# Altium schematic sheet Tiny_Matrix_Sch.SchDoc
size A; SheetNumber: 1; SheetTotal: 1
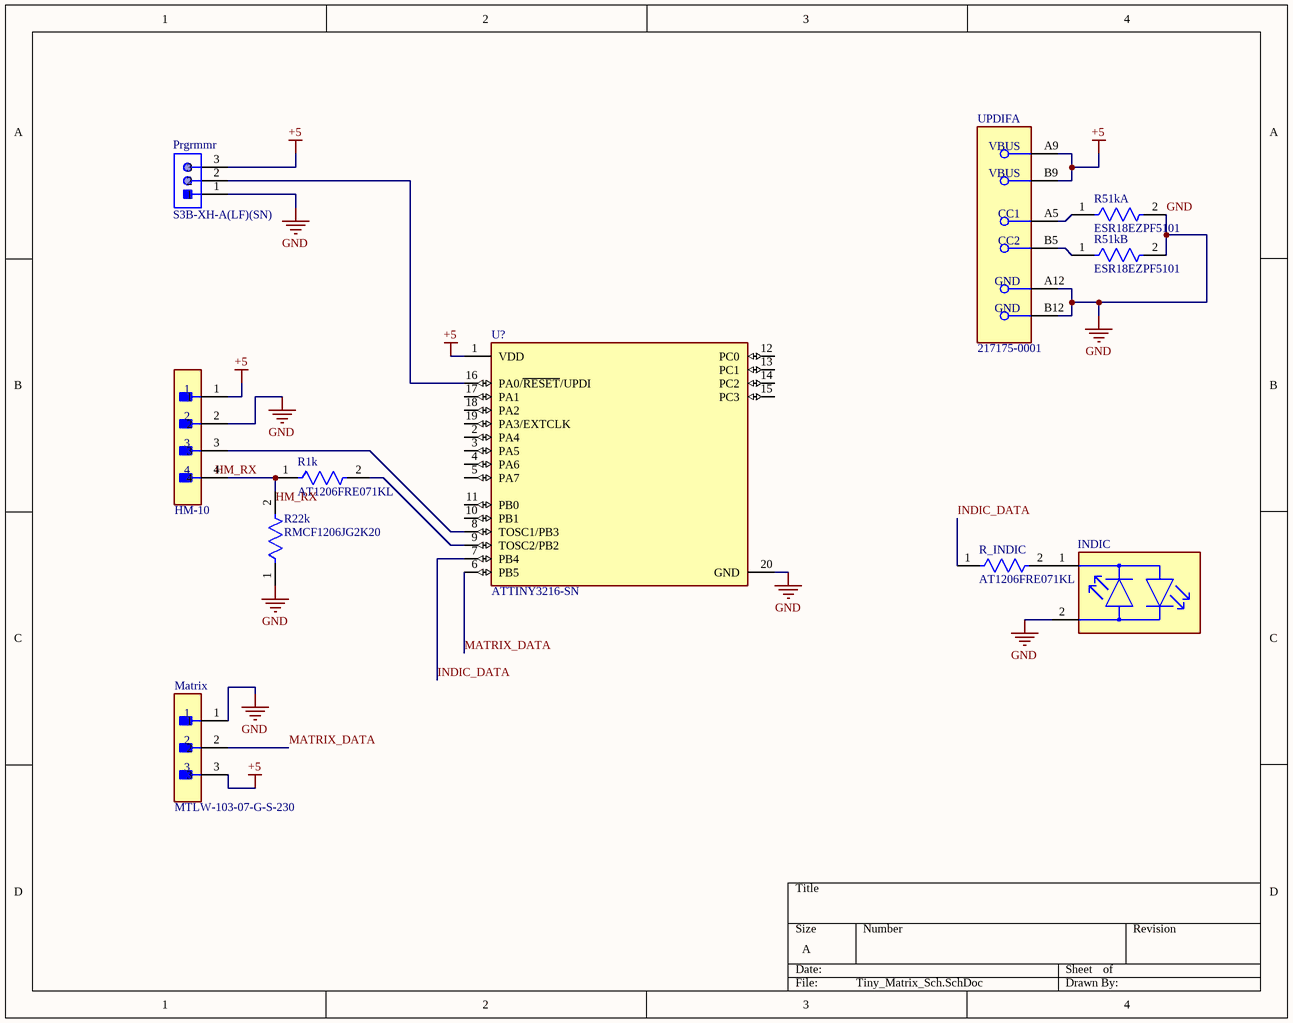
[diagram p0: Tiny_Matrix_Sch.SchDoc]

## Parts
HM-10  BT Module  [FP-MTLW-104-05-G-S-185-MFG]  (value not drawn)
INDIC  L-57IID  [FP-L-57IID-MFG]  (value not drawn)
Matrix  MTLW-103-07-G-S-230  [FP-MTLW-103-07-G-S-230-MFG]
Prgrmmr  S3B-XH-A(LF)(SN)  [JST-S3B-XH-A(LF)(SN)_V]
R1k  AT1206FRE071KL  [FP-AT1206-MFG]
R22k  RMCF1206JG2K20  [FP-RMCF1206-MFG]
R51kA  ESR18EZPF5101  [FP-ESR18-IPC_A]
R51kB  ESR18EZPF5101  [FP-ESR18-IPC_A]
R_INDIC  AT1206FRE071KL  [FP-AT1206-MFG]
U?  ATTINY3216-SN  [FP-C04-094-IPC_B]
UPDIF  217175-0001  [FP-217175-0001-MFG]  (part A of 2)

## Nets
+5: HM-10.1 Matrix.3 Prgrmmr.3 U?.1(VDD) UPDIF.A9(VBUS) UPDIF.B9(VBUS)
GND: HM-10.2 INDIC.2(1_ANODE/2_CATHODE) Matrix.1 Prgrmmr.1 R22k.1 R51kA.2 R51kB.2 U?.20(GND) UPDIF.A12(GND) UPDIF.B12(GND)
INDIC_DATA: R_INDIC.1 U?.7(PB4)
MATRIX_DATA: Matrix.2 U?.6(PB5)
NetHM-10_3: HM-10.3 U?.8(TOSC1/PB3)
NetHM-10_4: HM-10.4 R1k.1 R22k.2
NetINDIC_1: INDIC.1(1_CATHODE/2_ANODE) R_INDIC.2
NetPrgrmmr_2: Prgrmmr.2 U?.16(PA0/~{RESET}/UPDI)
NetR1k_2: R1k.2 U?.9(TOSC2/PB2)
NetR51kA_1: R51kA.1 UPDIF.A5(CC1)
NetR51kB_1: R51kB.1 UPDIF.B5(CC2)

Not connected (* = marked no-connect by the designer): U? 2(PA4) 3(PA5) 4(PA6) 5(PA7) 10(PB1) 11(PB0) 12(PC0) 13(PC1) 14(PC2) 15(PC3) 17(PA1) 18(PA2) 19(PA3/EXTCLK)

## Notes on the sheet
- Labels drawn without touching a wire or pin: HM_RX

## Library data of the parts
HM-10 = CMP-02766-000562-1: CONN HEADER VERT 4POS 2.54MM; Number of Contacts: 4; Contact Resistance: 15mR; Connector Type: Male Pin; Gender: Male; Contact Material: Brass; Height: 6.4mm; Contact Mating Length: 0.185inch; Length: 29.64mm; Number of Positions: 4; Packaging: Rail/Tube; Mount: Through Hole; Depth: 2.48mm; Number of Rows: 1; Radiation Hardening: No; Housing Material: Polymer; Pitch: 2.54mm; Max Operating Temperature: 105°C; Termination: Solder; Min Operating Temperature: -40°C; Color: Black; Orientation: Straight; Housing Color: Black; Contact Plating: Gold
INDIC = CMP-44529-000063-1: LED RED DIFFUSED T-1 3/4 T/H; Luminous Intensity: 20mcd; Dominant Wavelength: 625nm; Forward Voltage: 2V; Lens Style: Circular; Forward Current: 20mA; Number of LEDs: 2; Viewing Angle: 60°; Mount: Through Hole; Number of Pins: 2; Radiation Hardening: No; Color: Red; RoHS Compliant: Yes; Wavelength: 625nm; REACH SVHC: No SVHC; Lens Color: Red
Matrix = CMP-02766-001679-1: CONN HEADER VERT 3POS 2.54MM; Max Current Rating: 3A; Number of Contacts: 3; Gender: Male; Contact Material: Bronze; Pitch: 2.54mm; Housing Material: Polymer; Contact Plating: Gold; Radiation Hardening: No; Depth: 2.48mm; Packaging: Bulk; Number of Rows: 1; Max Operating Temperature: 125°C; Housing Color: Black; Termination: Solder; Min Operating Temperature: -55°C; Length: 7.62mm; RoHS Compliant: Yes; Orientation: Straight
Prgrmmr = CMP-1755-00006-1: Male Header, Pitch 2.5 mm, 1 x 3 Position, Height 6.1 mm, Tail Length 3.4 mm, -25 to 85 degC, RoHS, Bulk; Min Supply Voltage: 1 V; Frequency: 1.8 MHz; Channels: 1; Nominal Supply Current: 170 uA; Max Power Dissipation: 1 W; Max Ouput Current: -10 mA; Case\Package: DIP; Max Supply Voltage: 15 V; Min Operating Temperature: 0 degC; Weight: 0.015535 oz; Radiation Hardening: No; ComponentLink1URL: http://www.jst.com/home2.html; PackageReference: S3B-XH-A(LF)(SN); Length: 9.81 mm; Max Operating Temperature: 70 degC; Package Quantity: 50; REACH SVHC: No SVHC; Mount: Through Hole; Pins: 8; Height: 4.57 mm; DatasheetVersion: May-16; ComponentLink1Description: Manufacturer URL; PackageDescription: Male Header, Pitch 2.5 mm, 1 x 3 Position, Height 6.1 mm, Tail Length 3.4 mm; RoHSCompliant: true; Packaging: Rail/Tube; Width: 6.35 mm; ComponentLink2URL: http://www.jst-mfg.com/product/pdf/eng/eXH.pdf; ComponentLink2Description: Datasheet
R1k R_INDIC = CMP-03412-039742-1: Thin Film Chip Resistors Automotive Grade 1kΩ 1% 50ppm/°C 1206
R22k = CMP-26527-006686-1: 2.2kΩ ±5% 0.25W 1206 Thick Film Chip Resistor AEC-Q200 compliant; Resistance: 2.2kR; Temperature Coefficient: 200ppm/°C; Max Power Dissipation: 250mW; Tolerance: 5%; Length: 0.126inch; Resistor Type: Thick Film; Contact Plating: Tin; Height: 0.028inch; Features: Automotive AEC-Q200; Max Operating Temperature: 155°C; Packaging: Tape and Reel; Width: 0.063inch; Number of Terminations: 2; Radiation Hardening: No; Case/Package: 1206; Min Operating Temperature: -55°C; Mount: Surface Mount; RoHS Compliant: Yes; Series: RMCF
R51kA R51kB = CMP-08839-028234-1: 5.1kΩ ±1% 0.5W 1206 Anti-Surge Chip Resistor AEC-Q200; Temperature Coefficient: 100ppm/°C; Max Power Dissipation: 333mW; Resistance: 5.1kR; Resistor Type: Thick Film; Max Operating Temperature: 155°C; Min Operating Temperature: -55°C; Features: Automotive AEC-Q200; Height: 0.026inch; Length: 0.126inch; Packaging: Tape and Reel; Width: 0.063inch; Case/Package: 1206; Tolerance: 1%; Series: ESR18; Number of Terminations: 2; RoHS Compliant: Yes; Package Quantity: 5000
U? = CMP-06276-000249-1: IC MCU 8BIT 32KB FLASH 20SOIC; Oscillator Type: Internal; Number of I/Os: 18; Peripherals: Brown-out Detect/Reset; Core Architecture: AVR; Interface: I2C; Memory Size: 32KB; Memory Type: FLASH; RoHS Compliant: Yes; Max Operating Temperature: 105°C; Packaging: Rail/Tube; Mount: Surface Mount; Series: tinyAVR™ 1; Case/Package: SOIC; Min Operating Temperature: -40°C
UPDIF = CMP-04767-000026-1: CONN RCP USB2.0 C 6+18P SMD RA